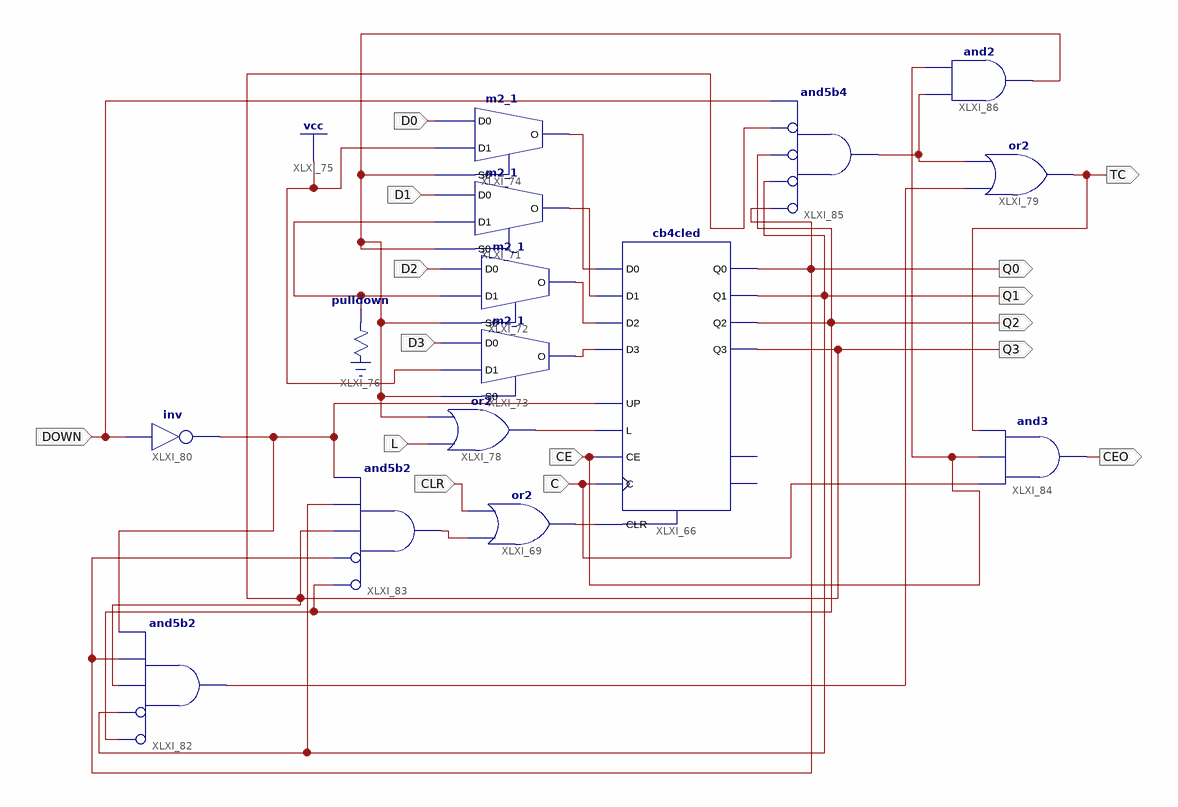
[diagram p0: schematic sheet 1]
// Xilinx ISE schematic DecimalCounterMod.sch (spartan3e) as structural Verilog: 15 symbols, 15 ports
module DecimalCounterMod (
  input  CLR,
  input  D0,
  input  D1,
  input  D2,
  input  D3,
  input  L,
  input  C,
  input  CE,
  input  DOWN,
  output Q2,
  output TC,
  output Q0,
  output Q1,
  output Q3,
  output CEO
);

  wire XLXN_120, XLXN_130, XLXN_132, XLXN_133, XLXN_134, XLXN_135, XLXN_142, XLXN_188, XLXN_194, XLXN_202,
       XLXN_205, XLXN_207;

  cb4cled XLXI_66 (
    .C(C), .CE(CE), .CLR(XLXN_120), .D0(XLXN_132), .D1(XLXN_133), .D2(XLXN_134), .D3(XLXN_135), .L(XLXN_142),
    .UP(XLXN_202), .Q0(Q0), .Q1(Q1), .Q2(Q2), .Q3(Q3));  // open: CEO, TC
  or XLXI_69 (XLXN_120, XLXN_194, CLR);
  m2_1 XLXI_71 (.D0(D1), .D1(XLXN_130), .S0(XLXN_207), .O(XLXN_133));
  m2_1 XLXI_72 (.D0(D2), .D1(XLXN_130), .S0(XLXN_207), .O(XLXN_134));
  m2_1 XLXI_73 (.D0(D3), .D1(1'b1), .S0(XLXN_207), .O(XLXN_135));
  m2_1 XLXI_74 (.D0(D0), .D1(1'b1), .S0(XLXN_207), .O(XLXN_132));
  \pulldown  XLXI_76 (.O(XLXN_130));
  or XLXI_78 (XLXN_142, L, XLXN_207);
  or XLXI_79 (TC, XLXN_188, XLXN_205);
  not XLXI_80 (XLXN_202, DOWN);
  and XLXI_82 (XLXN_188, ~Q2, ~Q1, Q3, Q0, XLXN_202);  // and5b2
  and XLXI_83 (XLXN_194, ~Q2, ~Q0, Q3, Q1, XLXN_202);  // and5b2
  and XLXI_84 (CEO, C, CE, TC);
  and XLXI_85 (XLXN_205, ~Q0, ~Q1, ~Q2, ~Q3, DOWN);  // and5b4
  and XLXI_86 (XLXN_207, XLXN_205, CE);
endmodule
